# Altium project CarrierBoard-v1.0.PrjPcb (part 2 of 2)

## Sheet Compute-Module-Sheet-1.SchDoc
size 420 x 297 mm; SheetNumber: 2; SheetTotal: 3
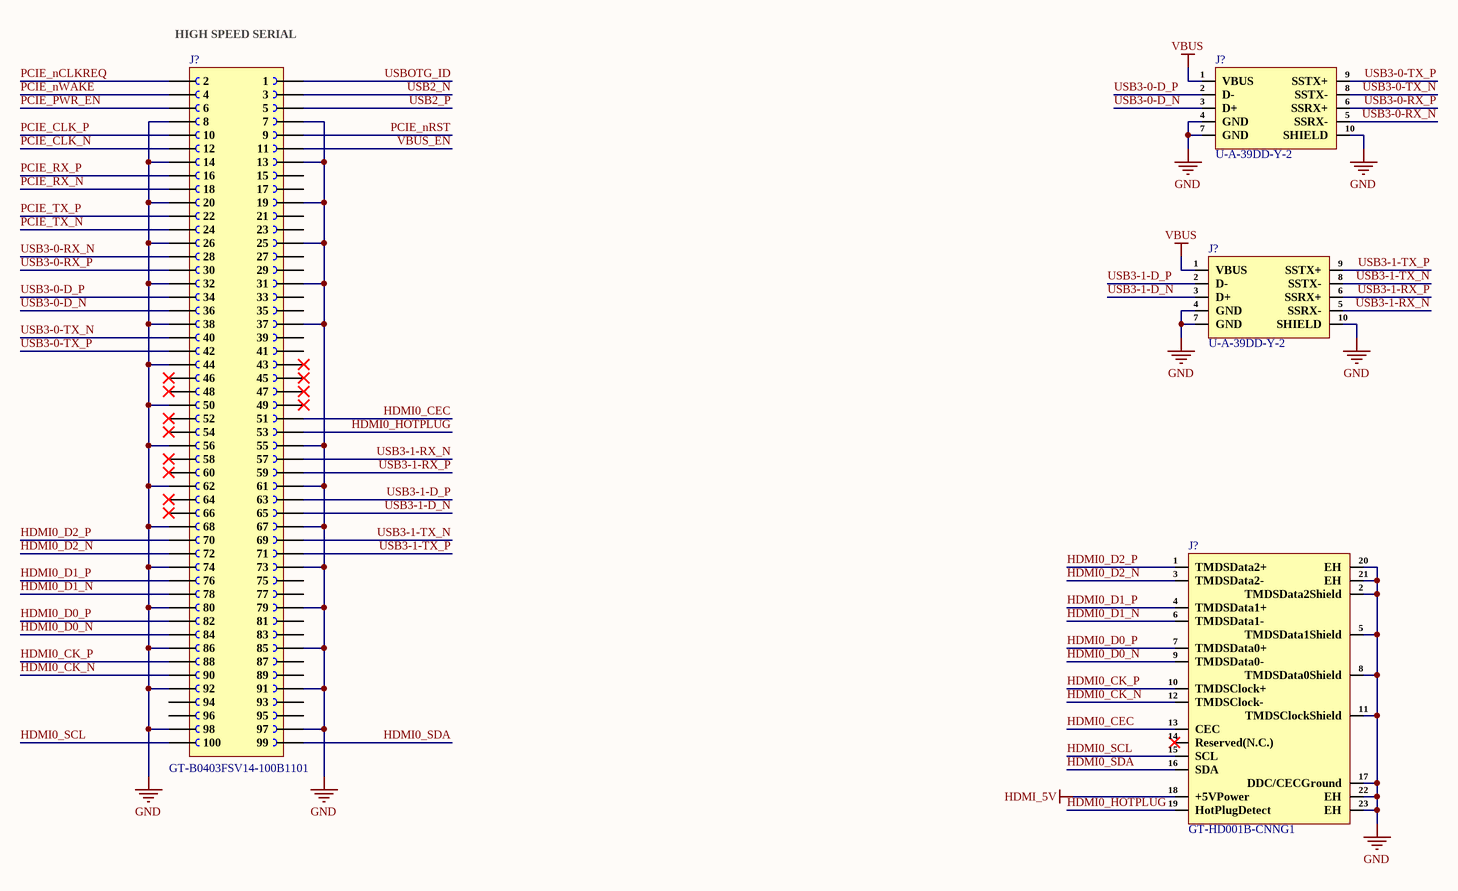
[diagram p1: Compute-Module-Sheet-1.SchDoc]

### Parts
(Parts that share a designator on the sheet are numbered #1, #2 ... from top to bottom, then left to right.)
J?#3  GT-B0403FSV14-100B1101  [GT-B0403FSV14-100B1101]
J?#4  U-A-39DD-Y-2  [U-A-39DD-Y-2]
J?#5  U-A-39DD-Y-2  [U-A-39DD-Y-2]
J?#6  GT-HD001B-CNNG1  [GT-HD001B-CNNG1]

### Nets
GND: J?#3.7 J?#3.8 J?#3.13 J?#3.14 J?#3.19 J?#3.20 J?#3.25 J?#3.26 J?#3.31 J?#3.32 J?#3.37 J?#3.38 J?#3.44 J?#3.50 J?#3.55 J?#3.56 J?#3.61 J?#3.62 J?#3.67 J?#3.68 J?#3.73 J?#3.74 J?#3.79 J?#3.80 J?#3.85 J?#3.86 J?#3.91 J?#3.92 J?#3.97 J?#3.98 J?#4.4(GND) J?#4.7(GND) J?#4.10(SHIELD) J?#5.4(GND) J?#5.7(GND) J?#5.10(SHIELD) J?#6.2(TMDSData2Shield) J?#6.5(TMDSData1Shield) J?#6.8(TMDSData0Shield) J?#6.11(TMDSClockShield) J?#6.17(DDC/CECGround) J?#6.20(EH) J?#6.21(EH) J?#6.22(EH) J?#6.23(EH)
HDMI_5V: J?#6.18(+5VPower)
VBUS: J?#4.1(VBUS) J?#5.1(VBUS)
HDMI0_CEC: J?#3.51 J?#6.13(CEC)
HDMI0_CK_N: J?#3.90 J?#6.12(TMDSClock-)
HDMI0_CK_P: J?#3.88 J?#6.10(TMDSClock+)
HDMI0_D0_N: J?#3.84 J?#6.9(TMDSData0-)
HDMI0_D0_P: J?#3.82 J?#6.7(TMDSData0+)
HDMI0_D1_N: J?#3.78 J?#6.6(TMDSData1-)
HDMI0_D1_P: J?#3.76 J?#6.4(TMDSData1+)
HDMI0_D2_N: J?#3.72 J?#6.3(TMDSData2-)
HDMI0_D2_P: J?#3.70 J?#6.1(TMDSData2+)
HDMI0_HOTPLUG: J?#3.53 J?#6.19(HotPlugDetect)
HDMI0_SCL: J?#3.100 J?#6.15(SCL)
HDMI0_SDA: J?#3.99 J?#6.16(SDA)
PCIE_CLK_N: J?#3.12
PCIE_CLK_P: J?#3.10
PCIE_nCLKREQ: J?#3.2
PCIE_nRST: J?#3.9
PCIE_nWAKE: J?#3.4
PCIE_PWR_EN: J?#3.6
PCIE_RX_N: J?#3.18
PCIE_RX_P: J?#3.16
PCIE_TX_N: J?#3.24
PCIE_TX_P: J?#3.22
USB2_N: J?#3.3
USB2_P: J?#3.5
USB3-0-D_N: J?#3.36 J?#4.3(D+)
USB3-0-D_P: J?#3.34 J?#4.2(D-)
USB3-0-RX_N: J?#3.28 J?#4.5(SSRX-)
USB3-0-RX_P: J?#3.30 J?#4.6(SSRX+)
USB3-0-TX_N: J?#3.40 J?#4.8(SSTX-)
USB3-0-TX_P: J?#3.42 J?#4.9(SSTX+)
USB3-1-D_N: J?#3.65 J?#5.3(D+)
USB3-1-D_P: J?#3.63 J?#5.2(D-)
USB3-1-RX_N: J?#3.57 J?#5.5(SSRX-)
USB3-1-RX_P: J?#3.59 J?#5.6(SSRX+)
USB3-1-TX_N: J?#3.69 J?#5.8(SSTX-)
USB3-1-TX_P: J?#3.71 J?#5.9(SSTX+)
USBOTG_ID: J?#3.1
VBUS_EN: J?#3.11

Not connected (* = marked no-connect by the designer): J?#3 15 17 21 23 27 29 33 35 39 41 43* 45* 46* 47* 48* 49* 52* 54* 58* 60* 64* 66* 75 77 81 83 87 89 93 94 95 96; J?#6 14(Reserved(N.C.))*

### Notes on the sheet
- (near J?#3) HIGH SPEED SERIAL
- File:
- Title:
- Date:
- Page
- Num:
- Total:
- Drawn By: Huzaifa Ali

### Library data of the parts
J?#3 = GT-B0403FSV14-100B1101: 0.4mm 2 100P -55℃~+125℃ Standing paste 0.3A SMD,P=0.4mm Board-to-Board and Backplane Connector ROHS; Manufacturer: G-Switch; Manufacturer Part Number: GT-B0403FSV14-100B1101; Package: SMD,P=0.4mm; LCSC Part Number: C42376244; Item Type: Connector; ComponentLink1Description: LCSC; ComponentLink1URL: https://www.lcsc.com/product-detail/Board-to-Board-and-Backplane-Connector_G-Switch-GT-B0403FSV14-100B1101_C42376244.html
J?#4 J?#5 = U-A-39DD-Y-2: USB 3.0 1.8A 1 Bend-in 9P Female Type-A Plugin USB Connectors ROHS; Manufacturer: Korean Hroparts Elec; Manufacturer Part Number: U-A-39DD-Y-2; Package: Plugin; LCSC Part Number: C707319; Item Type: USB Connector; ComponentLink1Description: LCSC; ComponentLink1URL: https://www.lcsc.com/product-detail/USB-Connectors_Korean-Hroparts-Elec-U-A-39DD-Y-2_C707319.html
J?#6 = GT-HD001B-CNNG1: SMD HDMI Connectors ROHS; Manufacturer: G-Switch; Manufacturer Part Number: GT-HD001B-CNNG1; Package: SMD; LCSC Part Number: C27636747; Item Type: HDMI Connector; ComponentLink1Description: LCSC; ComponentLink1URL: https://www.lcsc.com/product-detail/HDMI-Connectors_G-Switch-GT-HD001B-CNNG1_C27636747.html

## Sheet Compute-Module-Sheet-2.SchDoc
size 420 x 297 mm; SheetNumber: 3; SheetTotal: 3
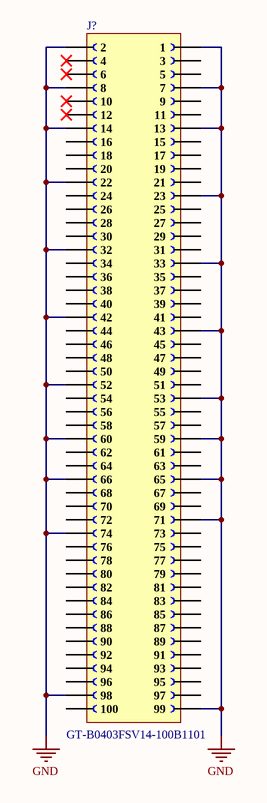
[diagram p2: Compute-Module-Sheet-2.SchDoc]

### Parts
(Parts that share a designator on the sheet are numbered #1, #2 ... from top to bottom, then left to right.)
J?#7  GT-B0403FSV14-100B1101  [GT-B0403FSV14-100B1101]

### Nets
GND: J?#7.1 J?#7.2 J?#7.7 J?#7.8 J?#7.13 J?#7.14 J?#7.22 J?#7.23 J?#7.32 J?#7.33 J?#7.42 J?#7.43 J?#7.52 J?#7.53 J?#7.59 J?#7.60 J?#7.65 J?#7.66 J?#7.71 J?#7.74 J?#7.98 J?#7.99

Not connected (* = marked no-connect by the designer): J?#7 3 4* 5 6* 9 10* 11 12* 15 16 17 18 19 20 21 24 25 26 27 28 29 30 31 34 35 36 37 38 39 40 41 44 45 46 47 48 49 50 51 54 55 56 57 58 61 62 63 64 67 68 69 70 72 73 75 76 77 78 79 80 81 82 83 84 85 86 87 88 89 90 91 92 93 94 95 96 97 100

### Notes on the sheet
- File:
- Title:
- Date:
- Page
- Num:
- Total:
- Drawn By: Huzaifa Ali

### Library data of the parts
J?#7 = GT-B0403FSV14-100B1101: as J?#3 on sheet Compute-Module-Sheet-1; Manufacturer Part Number: GT-B0403FSV14-100B1101; Package: SMD,P=0.4mm; LCSC Part Number: C42376244; Item Type: Connector; ComponentLink1Description: LCSC; ComponentLink1URL: https://www.lcsc.com/product-detail/Board-to-Board-and-Backplane-Connector_G-Switch-GT-B0403FSV14-100B1101_C42376244.html

## Nets that join several sheets
GND: Power-Sheet (52 pins), Compute-Module-Sheet-1 (45 pins), Compute-Module-Sheet-2 (22 pins)
HDMI_5V: Power-Sheet (C?#32.2 C?#33.2 U?#6.5), Compute-Module-Sheet-1 (J?#6.18)
VBUS: Power-Sheet (C?#27.1 C?#29.2 C?#30.2 U?#5.6), Compute-Module-Sheet-1 (J?#4.1 J?#5.1)
PCIE_PWR_EN: Power-Sheet (R?#8.2 U?#4.7), Compute-Module-Sheet-1 (J?#3.6)
USB2_N: Power-Sheet (J?#2.A7 J?#2.B7), Compute-Module-Sheet-1 (J?#3.3)
USB2_P: Power-Sheet (J?#2.A6 J?#2.B6), Compute-Module-Sheet-1 (J?#3.5)
VBUS_EN: Power-Sheet (U?#5.3), Compute-Module-Sheet-1 (J?#3.11)